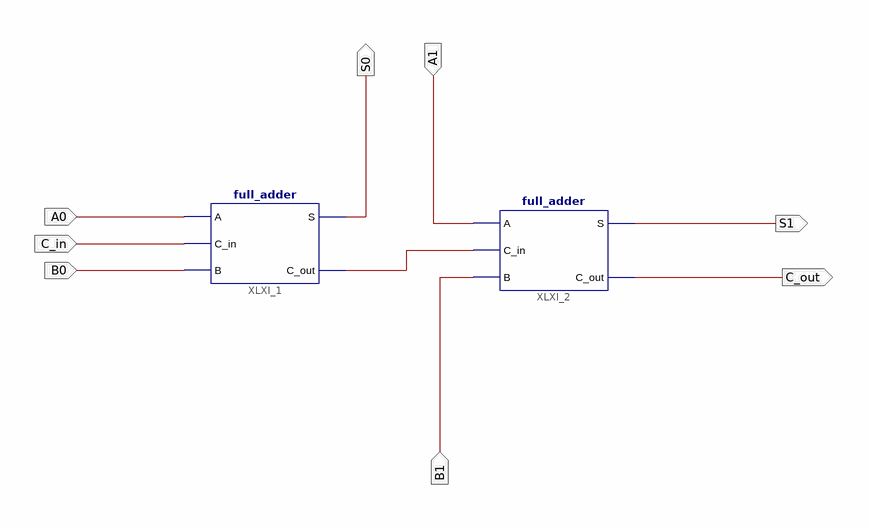
[diagram p0: schematic sheet 1]
// Xilinx ISE schematic adder_2bit.sch (spartan3e) as structural Verilog: 2 symbols, 8 ports
module adder_2bit (
  input  A0,
  input  C_in,
  input  B0,
  input  A1,
  input  B1,
  output S0,
  output S1,
  output C_out
);

  wire Carry0;

  full_adder XLXI_1 (.A(A0), .C_in(C_in), .B(B0), .S(S0), .C_out(Carry0));
  full_adder XLXI_2 (.A(A1), .C_in(Carry0), .B(B1), .S(S1), .C_out(C_out));
endmodule
